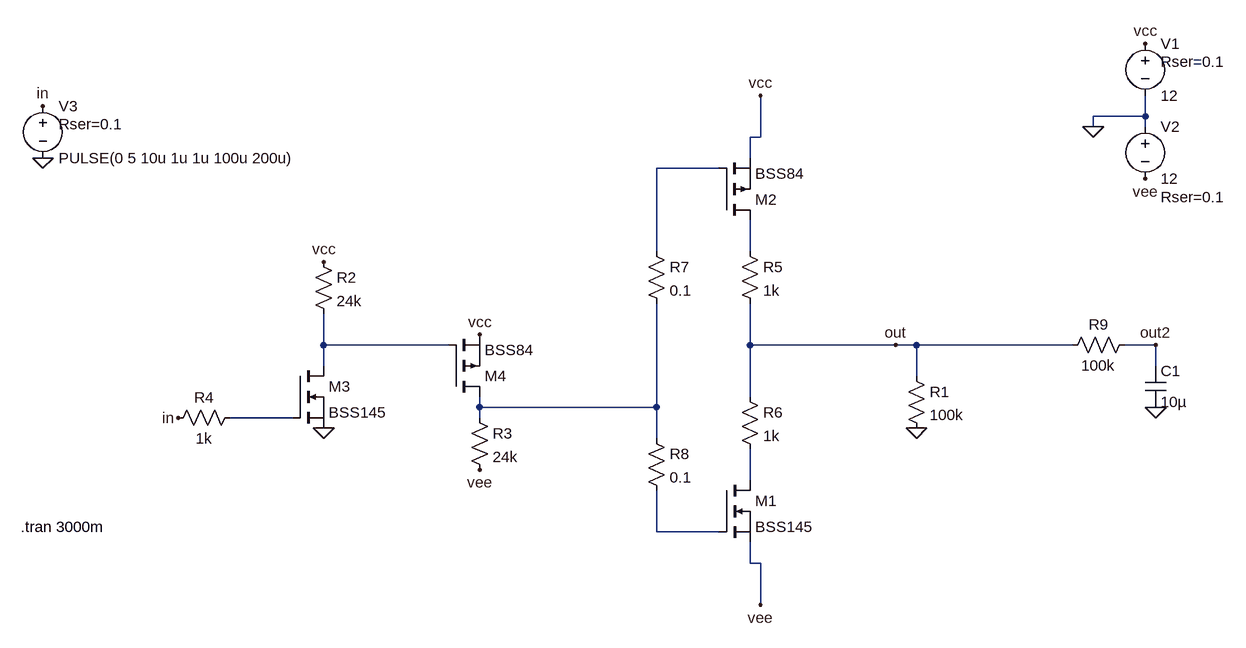
[diagram p0: schematic pull_push_trimmer.asc]
pull_push_trimmer.asc, the LTspice schematic file:
Version 4
SHEET 1 944 680
WIRE 816 -176 816 -208
WIRE 816 -176 736 -176
WIRE 736 -160 736 -176
WIRE 816 -160 816 -176
WIRE 224 -144 224 -208
WIRE 224 -144 208 -144
WIRE 208 -112 208 -144
WIRE 160 -96 64 -96
WIRE 64 32 64 -96
WIRE 208 32 208 -16
WIRE -448 176 -448 128
WIRE -256 176 -448 176
WIRE 208 176 208 112
WIRE 432 176 208 176
WIRE 464 176 432 176
WIRE 704 176 464 176
WIRE 832 176 784 176
WIRE -448 208 -448 176
WIRE 832 208 832 176
WIRE 464 224 464 176
WIRE 208 256 208 176
WIRE -208 272 -208 256
WIRE 64 272 64 112
WIRE 64 272 -208 272
WIRE -496 288 -592 288
WIRE -208 288 -208 272
WIRE 64 320 64 272
WIRE 208 384 208 336
WIRE 64 464 64 400
WIRE 160 464 64 464
WIRE 208 512 208 480
WIRE 224 512 208 512
WIRE 224 576 224 512
FLAG 736 -160 0
FLAG 464 304 0
FLAG 816 -288 vcc
FLAG 816 -80 vee
FLAG 224 576 vee
FLAG 224 -208 vcc
FLAG 432 176 out
FLAG -880 -112 0
FLAG -880 -192 in
FLAG -448 304 0
FLAG -448 48 vcc
FLAG -672 288 in
FLAG -208 368 vee
FLAG -208 160 vcc
FLAG 832 272 0
FLAG 832 176 out2
SYMBOL nmos 160 384 R0
SYMATTR InstName M1
SYMATTR Value BSS145
SYMBOL res 448 208 R0
SYMATTR InstName R1
SYMATTR Value 100k
SYMBOL pmos 160 -16 M180
SYMATTR InstName M2
SYMATTR Value BSS84
SYMBOL voltage 816 -304 R0
WINDOW 123 0 0 Left 2
WINDOW 39 24 44 Left 2
SYMATTR InstName V1
SYMATTR Value 12
SYMATTR SpiceLine Rser=0.1
SYMBOL voltage 816 -176 R0
WINDOW 123 0 0 Left 2
WINDOW 39 24 124 Left 2
SYMATTR InstName V2
SYMATTR Value 12
SYMATTR SpiceLine Rser=0.1
SYMBOL voltage -880 -208 R0
WINDOW 123 0 0 Left 2
WINDOW 39 24 44 Left 2
SYMATTR InstName V3
SYMATTR Value PULSE(0 5 10u 1u 1u 100u 200u)
SYMATTR SpiceLine Rser=0.1
SYMBOL nmos -496 208 R0
SYMATTR InstName M3
SYMATTR Value BSS145
SYMBOL res -464 32 R0
SYMATTR InstName R2
SYMATTR Value 24k
SYMBOL pmos -256 256 M180
SYMATTR InstName M4
SYMATTR Value BSS84
SYMBOL res -224 272 R0
SYMATTR InstName R3
SYMATTR Value 24k
SYMBOL res -576 272 R90
WINDOW 0 0 56 VBottom 2
WINDOW 3 32 56 VTop 2
SYMATTR InstName R4
SYMATTR Value 1k
SYMBOL res 192 16 R0
SYMATTR InstName R5
SYMATTR Value 1k
SYMBOL res 192 240 R0
SYMATTR InstName R6
SYMATTR Value 1k
SYMBOL res 48 16 R0
SYMATTR InstName R7
SYMATTR Value 0.1
SYMBOL res 48 304 R0
SYMATTR InstName R8
SYMATTR Value 0.1
SYMBOL res 800 160 R90
WINDOW 0 0 56 VBottom 2
WINDOW 3 32 56 VTop 2
SYMATTR InstName R9
SYMATTR Value 100k
SYMBOL cap 816 208 R0
SYMATTR InstName C1
SYMATTR Value 10µ
TEXT -914 456 Left 2 !.tran 3000m

The netlist it stands for:
* pull_push_trimmer.asc
M1 N006 N007 vee vee BSS145
R1 out 0 100k
M2 N002 N001 vcc vcc BSS84
V1 vcc 0 12 Rser=0.1
V2 0 vee 12 Rser=0.1
V3 in 0 PULSE(0 5 10u 1u 1u 100u 200u) Rser=0.1
M3 N003 N005 0 0 BSS145
R2 vcc N003 24k
M4 N004 N003 vcc vcc BSS84
R3 N004 vee 24k
R4 N005 in 1k
R5 N002 out 1k
R6 out N006 1k
R7 N001 N004 0.1
R8 N004 N007 0.1
R9 out2 out 100k
C1 out2 0 10µ
.model NMOS NMOS
.model PMOS PMOS
.lib standard.mos
.tran 3000m
.backanno
.end